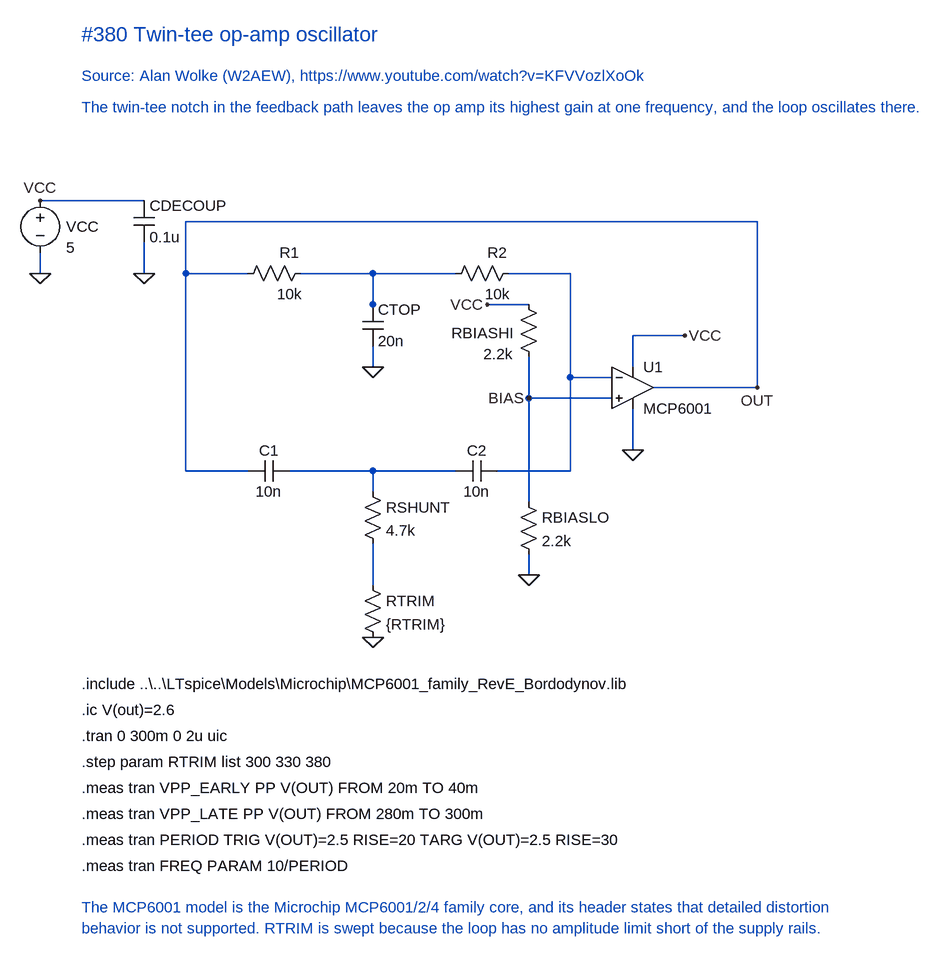
[diagram p0: schematic Op-amp twin-tee oscillator.asc]
Op-amp twin-tee oscillator.asc, the LTspice schematic file:
Version 4
SHEET 1 1700 1360
WIRE 320 208 1200 208
WIRE 320 288 320 208
WIRE 416 288 320 288
WIRE 608 288 496 288
WIRE 736 288 608 288
WIRE 912 288 816 288
WIRE 912 448 912 288
WIRE 976 448 912 448
WIRE 1040 464 1200 464
WIRE 1200 464 1200 208
WIRE 320 592 320 288
WIRE 416 592 320 592
WIRE 608 592 480 592
WIRE 736 592 608 592
WIRE 912 592 800 592
WIRE 912 592 912 448
WIRE 608 352 608 288
WIRE 608 432 608 400
WIRE 608 624 608 592
WIRE 608 768 608 704
WIRE 848 480 976 480
WIRE 848 432 848 480
WIRE 848 416 848 432
WIRE 784 336 848 336
WIRE 1008 384 1008 432
WIRE 1008 384 1088 384
WIRE 1008 496 1008 560
WIRE 848 752 848 720
WIRE 848 640 848 480
WIRE 96 176 256 176
WIRE 96 256 96 288
WIRE 256 240 256 288
FLAG 608 432 0
FLAG 608 848 0
FLAG 784 336 VCC
FLAG 848 752 0
FLAG 1088 384 VCC
FLAG 1008 560 0
FLAG 1200 464 OUT
FLAG 96 176 VCC
FLAG 96 288 0
FLAG 256 288 0
FLAG 848 480 BIAS
SYMBOL voltage 96 160 R0
WINDOW 0 40 56 Left 2
WINDOW 3 40 88 Left 2
SYMATTR InstName VCC
SYMATTR Value 5
SYMBOL cap 240 176 R0
SYMATTR InstName CDECOUP
SYMATTR Value 0.1u
SYMBOL res 512 272 R90
WINDOW 0 0 32 VBottom 2
WINDOW 3 32 32 VTop 2
SYMATTR InstName R1
SYMATTR Value 10k
SYMBOL res 832 272 R90
WINDOW 0 0 32 VBottom 2
WINDOW 3 32 32 VTop 2
SYMATTR InstName R2
SYMATTR Value 10k
SYMBOL cap 592 336 R0
SYMATTR InstName CTOP
SYMATTR Value 20n
SYMBOL cap 480 576 R90
WINDOW 0 0 32 VBottom 2
WINDOW 3 32 32 VTop 2
SYMATTR InstName C1
SYMATTR Value 10n
SYMBOL cap 800 576 R90
WINDOW 0 0 32 VBottom 2
WINDOW 3 32 32 VTop 2
SYMATTR InstName C2
SYMATTR Value 10n
SYMBOL res 592 608 R0
SYMATTR InstName RSHUNT
SYMATTR Value 4.7k
SYMBOL res 592 752 R0
SYMATTR InstName RTRIM
SYMATTR Value {RTRIM}
SYMBOL res 832 320 R0
WINDOW 0 -8 60 Right 2
WINDOW 3 -8 92 Right 2
SYMATTR InstName RBIASHI
SYMATTR Value 2.2k
SYMBOL res 832 624 R0
SYMATTR InstName RBIASLO
SYMATTR Value 2.2k
SYMBOL Opamps\opamp2 1008 400 R0
SYMATTR InstName U1
SYMATTR Value MCP6001
TEXT 160 -80 Left 3 ;#380 Twin-tee op-amp oscillator
TEXT 160 -16 Left 2 ;Source: Alan Wolke (W2AEW), https://www.youtube.com/watch?v=KFVVozlXoOk
TEXT 160 32 Left 2 ;The twin-tee notch in the feedback path leaves the op amp its highest gain at one frequency, and the loop oscillates there.
TEXT 160 920 Left 2 !.include ..\..\LTspice\Models\Microchip\MCP6001_family_RevE_Bordodynov.lib
TEXT 160 960 Left 2 !.ic V(out)=2.6
TEXT 160 1000 Left 2 !.tran 0 300m 0 2u uic
TEXT 160 1040 Left 2 !.step param RTRIM list 300 330 380
TEXT 160 1080 Left 2 !.meas tran VPP_EARLY PP V(OUT) FROM 20m TO 40m
TEXT 160 1120 Left 2 !.meas tran VPP_LATE PP V(OUT) FROM 280m TO 300m
TEXT 160 1160 Left 2 !.meas tran PERIOD TRIG V(OUT)=2.5 RISE=20 TARG V(OUT)=2.5 RISE=30
TEXT 160 1200 Left 2 !.meas tran FREQ PARAM 10/PERIOD
TEXT 160 1264 Left 2 ;The MCP6001 model is the Microchip MCP6001/2/4 family core, and its header states that detailed distortion
TEXT 160 1296 Left 2 ;behavior is not supported. RTRIM is swept because the loop has no amplitude limit short of the supply rails.

The netlist it stands for:
* Op-amp twin-tee oscillator.asc
VCC VCC 0 5
CDECOUP VCC 0 0.1u
R1 N001 OUT 10k
R2 N002 N001 10k
CTOP N001 0 20n
C1 N003 OUT 10n
C2 N002 N003 10n
RSHUNT N003 N004 4.7k
RTRIM N004 0 {RTRIM}
RBIASHI VCC BIAS 2.2k
RBIASLO BIAS 0 2.2k
XU1 BIAS N002 VCC 0 OUT MCP6001  ; pins In+ In- V+ V- OUT
* #380 Twin-tee op-amp oscillator
* Source: Alan Wolke (W2AEW), https://www.youtube.com/watch?v=KFVVozlXoOk
* The twin-tee notch in the feedback path leaves the op amp its highest gain at one frequency, and the loop oscillates there.
.include ..\..\LTspice\Models\Microchip\MCP6001_family_RevE_Bordodynov.lib
.ic V(out)=2.6
.tran 0 300m 0 2u uic
.step param RTRIM list 300 330 380
.meas tran VPP_EARLY PP V(OUT) FROM 20m TO 40m
.meas tran VPP_LATE PP V(OUT) FROM 280m TO 300m
.meas tran PERIOD TRIG V(OUT)=2.5 RISE=20 TARG V(OUT)=2.5 RISE=30
.meas tran FREQ PARAM 10/PERIOD
* The MCP6001 model is the Microchip MCP6001/2/4 family core, and its header states that detailed distortion
* behavior is not supported. RTRIM is swept because the loop has no amplitude limit short of the supply rails.
.backanno
.end